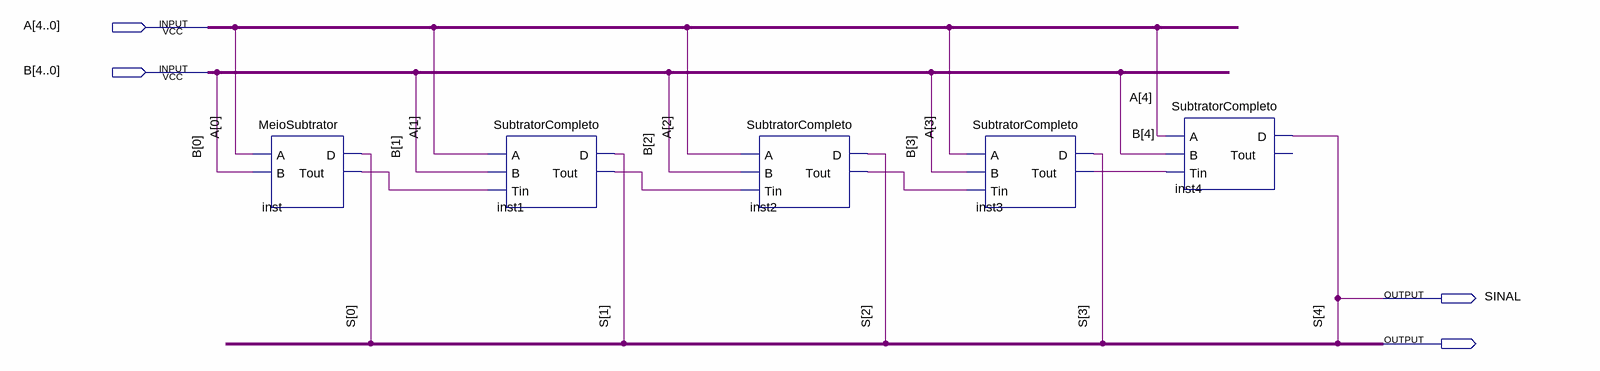
[diagram p0: schematic sheet]
// Quartus schematic Subtrator5Bits.bdf as structural Verilog: 5 symbols, 4 pins
module Subtrator5Bits (
  input  [4:0] A,
  input  [4:0] B,
  output SINAL
);

  wire inst1_tout, inst2_tout, inst3_tout, inst_tout;
  wire [3:0] S;

  MeioSubtrator inst (.A(A[0]), .B(B[0]), .D(S[0]), .Tout(inst_tout));
  SubtratorCompleto inst1 (.A(A[1]), .B(B[1]), .Tin(inst_tout), .D(S[1]), .Tout(inst1_tout));
  SubtratorCompleto inst2 (.A(A[2]), .B(B[2]), .Tin(inst1_tout), .D(S[2]), .Tout(inst2_tout));
  SubtratorCompleto inst3 (.A(A[3]), .B(B[3]), .Tin(inst2_tout), .D(S[3]), .Tout(inst3_tout));
  SubtratorCompleto inst4 (.A(A[4]), .B(B[4]), .Tin(inst3_tout), .D(SINAL));  // open: Tout

  // Other names for the same wires on the sheet: S[4] = SINAL
endmodule
